# Altium project Carrier-Board-v1.0.PrjPcb (part 3 of 9)

## Sheet ETHERNET_INTERFACE.SchDoc
size A4; SheetNumber: 5; SheetTotal: 20
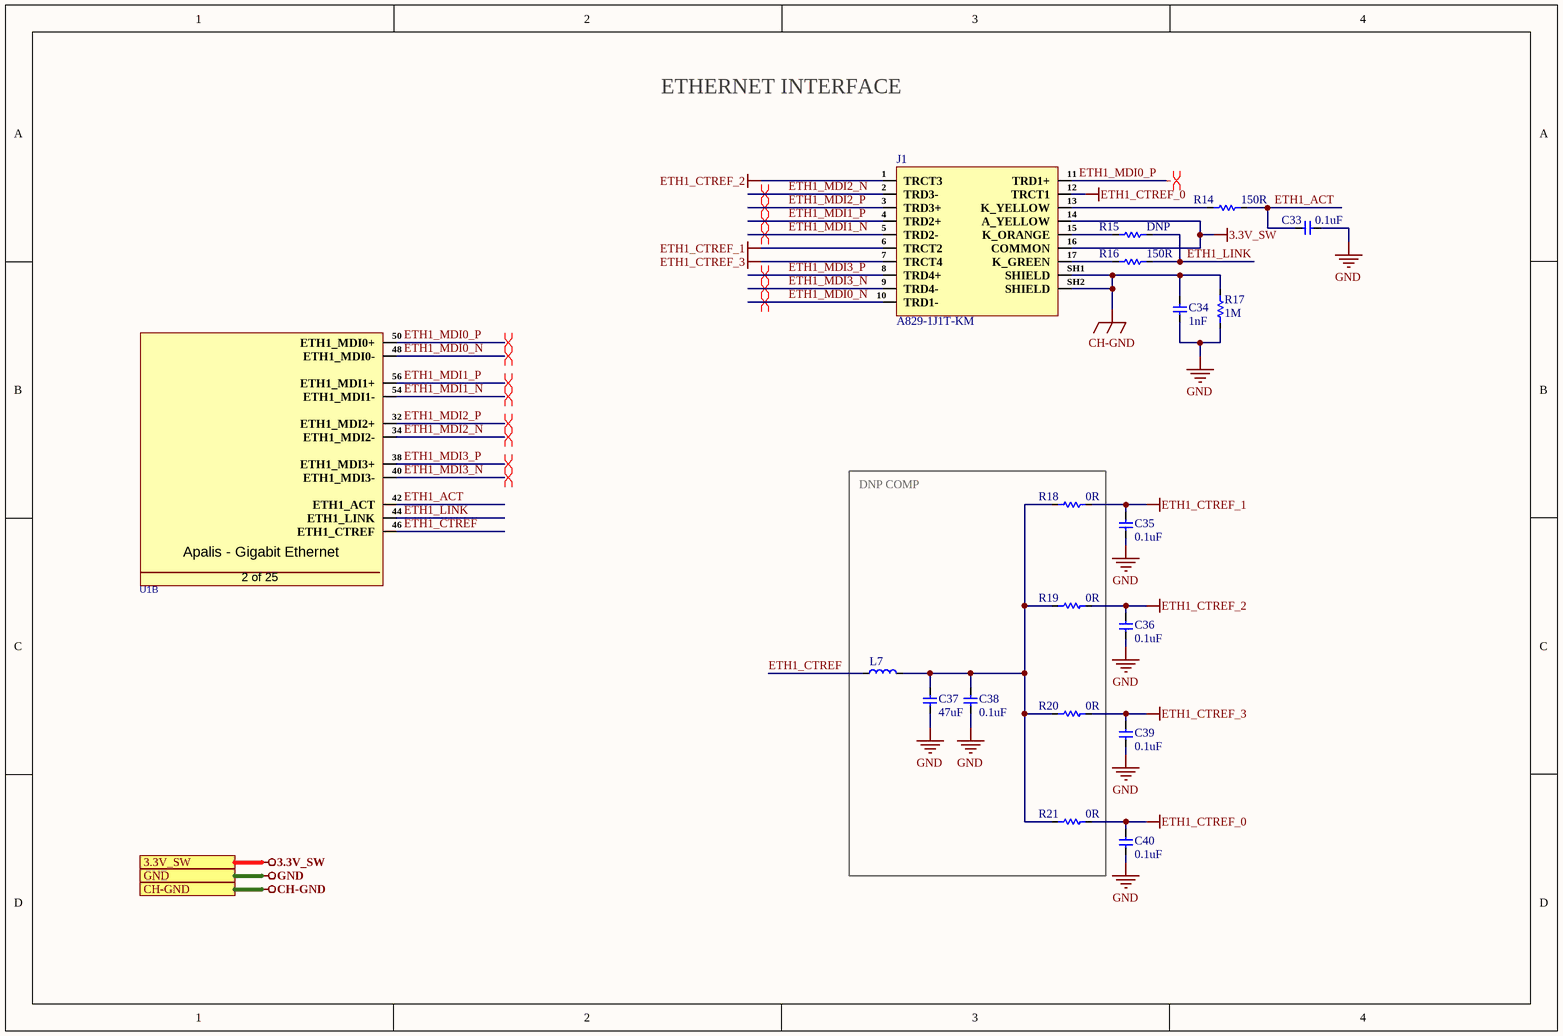
[diagram p4: ETHERNET_INTERFACE.SchDoc]

### Parts
C33  0.1uF  [Cap-0402]
C34  1nF  [Cap-1206]
C35  0.1uF  [Cap-0402]
C36  0.1uF  [Cap-0402]
C37  47uF  [Cap 2220]
C38  0.1uF  [Cap-0402]
C39  0.1uF  [Cap-0402]
C40  0.1uF  [Cap-0402]
J1  A829-1J1T-KM  [A829-1J1T-KM]
L7  BLM18EG221TN1D  [IND-0603 (1608 Metric)]  (value not drawn)
R14  150R  [Res-0402]
R15  DNP  [Res-0402]
R16  150R  [Res-0402]
R17  1M  [Res-0402]
R18  0R  [Res-0402]
R19  0R  [Res-0402]
R20  0R  [Res-0402]
R21  0R  [Res-0402]
U1  MM70-314B1-2-R300  [MM70-314B1-2-R300]  (value not drawn)  (part B of 25)

### Blocks framed on the sheet
DNP COMP: C37 C38 L7 R18-R21

### Ports
3.3V_SW (see Top_Sheet[1B], DIGITAL_I-O_O-P[1D], FUTURE_USE_CONNECTOR[1D], HDMI_INTERFACE[1D], I2C_INTERFACE[1B], MICRO_SD_CARD_INTERFACE[1D], UART_INTERFACE[1D]), CH-GND (see Top_Sheet[1B], HDMI_INTERFACE[1D], LTE_MODULE[1D], MECHANICAL_FOR_PCB[1D], USB3.0_INTERFACE[1D]), GND (see Top_Sheet[1B], 03-CAN2_SPI_CAN_CONTROLLER[1D], APALIS_POWER_SUPPLY[1D], CAN2_SPI_CAN_CONTROLLER[1D], CODEC_INTERFACE[1D], CONNECTORS[1D], DC_DC_CONVERTER[1D], DIGITAL_I-O_O-P[1D], FUTURE_USE_CONNECTOR[1D], GPIO_NC_INTERFACE[4B], HDMI_INTERFACE[1D], I2C_INTERFACE[1B], INPUT_SUPPLY_PROTECTION[1D], LTE_MODULE[1D], MECHANICAL_FOR_PCB[1D], MICRO_SD_CARD_INTERFACE[1D], Reset_and_SDIO[1D], UART_INTERFACE[1D], USB3.0_INTERFACE[1D])

### Nets
3.3V_SW: J1.14(A_YELLOW) J1.16(COMMON) ; port 3.3V_SW
CH-GND: C34.2 J1.SH1(SHIELD) J1.SH2(SHIELD) R17.2 ; port CH-GND
ETH1_CTREF_0: C40.2 J1.12(TRCT1) R21.2
ETH1_CTREF_1: C35.2 J1.6(TRCT2) R18.2
ETH1_CTREF_2: C36.2 J1.1(TRCT3) R19.2
ETH1_CTREF_3: C39.2 J1.7(TRCT4) R20.2
GND: C33.2 C34.1 C35.1 C36.1 C37.1 C38.1 C39.1 C40.1 R17.1 ; port GND
ETH1_ACT: C33.1 R14.2 U1.42(ETH1_ACT)
ETH1_CTREF: L7.1 U1.46(ETH1_CTREF)
ETH1_LINK: R15.2 R16.2 U1.44(ETH1_LINK)
ETH1_MDI0_N: J1.10(TRD1-) U1.48(ETH1_MDI0-)
ETH1_MDI0_P: J1.11(TRD1+) U1.50(ETH1_MDI0+)
ETH1_MDI1_N: J1.5(TRD2-) U1.54(ETH1_MDI1-)
ETH1_MDI1_P: J1.4(TRD2+) U1.56(ETH1_MDI1+)
ETH1_MDI2_N: J1.2(TRD3-) U1.34(ETH1_MDI2-)
ETH1_MDI2_P: J1.3(TRD3+) U1.32(ETH1_MDI2+)
ETH1_MDI3_N: J1.9(TRD4-) U1.40(ETH1_MDI3-)
ETH1_MDI3_P: J1.8(TRD4+) U1.38(ETH1_MDI3+)
NetC37_2: C37.2 C38.2 L7.2 R18.1 R19.1 R20.1 R21.1
NetJ1_13: J1.13(K_YELLOW) R14.1
NetJ1_15: J1.15(K_ORANGE) R15.1
NetJ1_17: J1.17(K_GREEN) R16.1

### Layout directives
differential pair; differential pair class DIFF-ETH-100; rule Impedance Constraint [Min = 98.00    Max = 103.0    ]; rule Matched Net Lengths [Tolerance = 0.508mm]: ETH1_MDI0_N, ETH1_MDI0_P, ETH1_MDI1_N, ETH1_MDI1_P, ETH1_MDI2_N, ETH1_MDI2_P, ETH1_MDI3_N, ETH1_MDI3_P

### Notes on the sheet
- ETHERNET INTERFACE
- (in symbol MM70-314B1-2-R300, part B) Apalis - Gigabit Ethernet; 2 of 25

### Library data of the parts
C33 C35 C36 C38-C40 = C0402C104K4REC7867: as C7 on sheet APALIS_POWER_SUPPLY; Supplier: Digi-Key; Supplier Part Number: 399-C0402C104K4REC7867CT-ND; Manufacturer Part Number: C0402C104K4REC7867; RoHS: No; Category: Ceramic Capacitors; Stock: 10918; Pricing: 1=0.1, 10=0.072, 50=0.0408, 100=0.0338, 500=0.02372, 1000=0.01963, 2500=0.01827, 5000=0.01672 (USD)
C34 = C1206C102KGRACAUTO: CAP CER 1000PF 2KV X7R 1206; Manufacturer: KEMET; Dielectric Material: Ceramic; Tolerance: 10%; Supplier: Mouser; Supplier Part Number: 80-C1206C102KGRAUTO; Manufacturer Part Number: C1206C102KGRACAUTO; RoHS: No; Category: Ceramic Capacitors; Stock: 90441; Pricing: 1=0.26, 10=0.119, 50=0.119, 100=0.072, 1000=0.063, 10000=0.052 (USD); Mounting Technology: Surface Mount; Case/Package: 1206; Case Code (Metric): 3216; Case Code (Imperial): 1206; Contact Plating: Tin,Matte; Min Operating Temperature: -55°C; Max Operating Temperature: 125°C; Voltage Rating: 2kV; Packaging: Cut Tape; Value: 1nF; Dielectric: X7R; Termination: SMD/SMT; Voltage Rating (DC): 2kV; Series: SMD Auto X7R HV; Construction: Flat; Length: 3.2mm; Ratings: AEC-Q200; Reach SVHC Compliant: No; RoHS Compliant: No; ComponentLink1URL: http://www.farnell.com/datasheets/2741171.pdf?src-supplier=Farnell; ComponentLink1Description: http://www.farnell.com/datasheets/2741171.pdf?src-supplier=Farnell; ComponentLink2URL: http://www.mouser.com/ds/2/212/KEM_C1010_X7R_HV_SMD-1102742.pdf?src-supplier=Mouser; ComponentLink2Description: http://www.mouser.com/ds/2/212/KEM_C1010_X7R_HV_SMD-1102742.pdf?src-supplier=Mouser; ComponentLink3URL: http://capacitoredge.kemet.com/capedge2/DataSheet/Datasheet-C1206C102KGRACAUTO.pdf?pn=C1206C102KGRACAUTO&src-supplier=Avnet; ComponentLink3Description: http://capacitoredge.kemet.com/capedge2/DataSheet/Datasheet-C1206C102KGRACAUTO.pdf?pn=C1206C102KGRACAUTO&src-supplier=Avnet; ComponentLink4URL: http://www.farnell.com/datasheets/2741171.pdf?src-supplier=Newark; ComponentLink4Description: http://www.farnell.com/datasheets/2741171.pdf?src-supplier=Newark; ComponentLink5URL: https://datasheet.octopart.com/C1206C102KGRACAUTO-Kemet-datasheet-41767101.pdf?src-supplier=Newark; ComponentLink5Description: https://datasheet.octopart.com/C1206C102KGRACAUTO-Kemet-datasheet-41767101.pdf?src-supplier=Newark; ComponentLink6URL: https://api.kemet.com/component-edge/download/datasheet/C1206C102KGRACAUTO.pdf?src-supplier=Digi-Key; ComponentLink6Description: https://api.kemet.com/component-edge/download/datasheet/C1206C102KGRACAUTO.pdf?src-supplier=Digi-Key; ComponentLink7URL: https://datasheet.octopart.com/C1206C102KGRACAUTO-KEMET-datasheet-149525142.pdf?src-supplier=Farnell; ComponentLink7Description: https://datasheet.octopart.com/C1206C102KGRACAUTO-KEMET-datasheet-149525142.pdf?src-supplier=Farnell; ComponentLink8URL: http://www.farnell.com/datasheets/2741171.pdf?src-supplier=Element14; ComponentLink8Description: http://www.farnell.com/datasheets/2741171.pdf?src-supplier=Element14; ComponentLink9URL: https://datasheet.octopart.com/C1206C102KGRACAUTO-Kemet-datasheet-66532414.pdf?src-supplier=Element14; ComponentLink9Description: https://datasheet.octopart.com/C1206C102KGRACAUTO-Kemet-datasheet-66532414.pdf?src-supplier=Element14; ComponentLink10URL: https://datasheet.octopart.com/C1206C102KGRACAUTO-KEMET-datasheet-140424778.pdf?src-supplier=TME; ComponentLink10Description: https://datasheet.octopart.com/C1206C102KGRACAUTO-KEMET-datasheet-140424778.pdf?src-supplier=TME; ComponentLink11URL: https://datasheet.octopart.com/C1206C102KGRACAUTO-KEMET-datasheet-147336163.pdf?src-supplier=LKR; ComponentLink11Description: https://datasheet.octopart.com/C1206C102KGRACAUTO-KEMET-datasheet-147336163.pdf?src-supplier=LKR
C37 = CGA9N3X7R1E476M230KB: CAP CER 47UF 25V X7R 2220; Manufacturer: TDK; Material: 4241ConductorMaterial; Tolerance: 20%; Supplier: Rs; Supplier Part Number: 2427522; Manufacturer Part Number: CGA9N3X7R1E476M230KB; RoHS: Yes; Category: Ceramic Capacitors; Stock: 467; Pricing: 1=3.07, 5=2.92, 10=2.76, 20=2.46, 100=2 (GBP); Mounting Technology: Surface Mount; Case/Package: 2220; Case Code (Imperial): 2220; Case Code (Metric): 5750; Min Operating Temperature: -55°C; Max Operating Temperature: 125°C; Packaging: Cut Tape; Value: 47uF; Voltage Rating: 25V; Series: CGA; Length: 5.7mm; Width: 5mm; Height: 2.8mm; Ratings: AEC-Q200; RoHS Compliant: Yes; ComponentLink1URL: https://product.tdk.com/info/en/catalog/spec/mlccspec_automotive_general_midvoltage_en.pdf?src-supplier=Digi-Key; ComponentLink1Description: https://product.tdk.com/info/en/catalog/spec/mlccspec_automotive_general_midvoltage_en.pdf?src-supplier=Digi-Key; ComponentLink2URL: https://product.tdk.com/info/en/catalog/datasheets/mlcc_automotive_general_en.pdf?src-supplier=Digi-Key; ComponentLink2Description: https://product.tdk.com/info/en/catalog/datasheets/mlcc_automotive_general_en.pdf?src-supplier=Digi-Key; ComponentLink3URL: https://product.tdk.com/info/en/catalog/datasheets/mlcc_automotive_general_en.pdf?ref_disty=digikey&src-supplier=Digi-Key; ComponentLink3Description: https://product.tdk.com/info/en/catalog/datasheets/mlcc_automotive_general_en.pdf?ref_disty=digikey&src-supplier=Digi-Key; ComponentLink4URL: https://datasheet.octopart.com/CGA9N3X7R1E476M230KB-TDK-datasheet-43366117.pdf?src-supplier=Future+Electronics; ComponentLink4Description: https://datasheet.octopart.com/CGA9N3X7R1E476M230KB-TDK-datasheet-43366117.pdf?src-supplier=Future+Electronics
J1 = A829-1J1T-KM: CONN JACK 1PORT 1000 BASE-TX PCB; Manufacturer: Bel; Supplier: Mouser; Supplier Part Number: 530-A829-1J1T-KM; Manufacturer Part Number: A829-1J1T-KM; RoHS: Yes; Category: Modular / Ethernet Connectors; Stock: 1152; Pricing: 1=7.48, 10=6.77, 50=6.4, 100=6.4, 1000=4.99, 10000=4.99 (USD); ComponentLink1URL: https://belfuse.com/resources/drawings/magneticsolutions/dr-mag-a829-1j1t-km.pdf?src-supplier=Digi-Key; ComponentLink1Description: https://belfuse.com/resources/drawings/magneticsolutions/dr-mag-a829-1j1t-km.pdf?src-supplier=Digi-Key; ComponentLink2URL: https://datasheet.octopart.com/A829-1J1T-KM-Bel-Fuse-datasheet-154547170.pdf?src-supplier=Electro+Sonic; ComponentLink2Description: https://datasheet.octopart.com/A829-1J1T-KM-Bel-Fuse-datasheet-154547170.pdf?src-supplier=Electro+Sonic
L7 = BLM18EG221TN1D: FERRITE BEAD 220 OHM 0603 1LN; Manufacturer: Murata; Supplier: Avnet; Supplier Part Number: BLM18EG221TN1D; Manufacturer Part Number: BLM18EG221TN1D; RoHS: Yes; Category: Ferrite Beads and Chips; Stock: 4000; Pricing: 4000=0.07735, 8000=0.07553, 16000=0.07371, 24000=0.07189, 32000=0.07007 (USD); ComponentLink1URL: https://datasheet.ciiva.com/11795/0900766b811b5866-11795384.pdf?src-supplier=Rs; ComponentLink1Description: https://datasheet.ciiva.com/11795/0900766b811b5866-11795384.pdf?src-supplier=Rs; ComponentLink2URL: https://datasheet.ciiva.com/41449/001172266-da-01-en-drossel-0603-220r-1-6x0-8mm-4000st-41449580.pdf?src-supplier=Conrad; ComponentLink2Description: https://datasheet.ciiva.com/41449/001172266-da-01-en-drossel-0603-220r-1-6x0-8mm-4000st-41449580.pdf?src-supplier=Conrad; ComponentLink3URL: https://datasheet.ciiva.com/1467/5169-1467159.pdf?src-supplier=Element14; ComponentLink3Description: https://datasheet.ciiva.com/1467/5169-1467159.pdf?src-supplier=Element14; ComponentLink4URL: https://datasheet.ciiva.com/1467/5169-1467160.pdf?src-supplier=Element14; ComponentLink4Description: https://datasheet.ciiva.com/1467/5169-1467160.pdf?src-supplier=Element14; ComponentLink5URL: https://datasheet.ciiva.com/8510/l0110s0101blm18e-8510167.pdf?src-supplier=Avnet; ComponentLink5Description: https://datasheet.ciiva.com/8510/l0110s0101blm18e-8510167.pdf?src-supplier=Avnet; ComponentLink6URL: https://datasheet.ciiva.com/16419/l0110s0101blm18e-16419150.pdf?src-supplier=Future+Electronics; ComponentLink6Description: https://datasheet.ciiva.com/16419/l0110s0101blm18e-16419150.pdf?src-supplier=Future+Electronics; ComponentLink7URL: https://datasheet.ciiva.com/6211/l0110s0101blm18e-6211853.pdf?src-supplier=Digi-Key; ComponentLink7Description: https://datasheet.ciiva.com/6211/l0110s0101blm18e-6211853.pdf?src-supplier=Digi-Key
R14-R16 = CRGCQ0402F150R: RES 150 OHM 1% 1/16W 0402; Manufacturer: TE Connectivity; Supplier: Arrow Electronics; Supplier Part Number: CRGCQ0402F150R; Manufacturer Part Number: CRGCQ0402F150R; RoHS: Yes; Category: Chip SMD Resistors; Stock: 712; Pricing: 1=0.0975, 10=0.0101, 25=0.01, 100=0.0051, 250=0.005, 500=0.0042 (USD); ComponentLink1URL: http://datasheet.octopart.com/CRGCQ0402F150R-TE-Connectivity-datasheet-114679081.pdf?src-supplier=Verical; ComponentLink1Description: http://datasheet.octopart.com/CRGCQ0402F150R-TE-Connectivity-datasheet-114679081.pdf?src-supplier=Verical; ComponentLink2URL: http://datasheet.octopart.com/CRGCQ0402F150R-TE-Connectivity-datasheet-114679081.pdf?src-supplier=Avnet; ComponentLink2Description: http://datasheet.octopart.com/CRGCQ0402F150R-TE-Connectivity-datasheet-114679081.pdf?src-supplier=Avnet; ComponentLink3URL: http://datasheet.octopart.com/CRGCQ0402F150R-TE-Connectivity-datasheet-114679081.pdf?src-supplier=Newark; ComponentLink3Description: http://datasheet.octopart.com/CRGCQ0402F150R-TE-Connectivity-datasheet-114679081.pdf?src-supplier=Newark; ComponentLink4URL: https://4donline.ihs.com/images/VipMasterIC/IC/TYEL/TYEL-S-A0004929575/TYEL-S-A0004929575-1.pdf?hkey=52A5661711E402568146F3353EA87419&src-supplier=Newark; ComponentLink4Description: https://4donline.ihs.com/images/VipMasterIC/IC/TYEL/TYEL-S-A0004929575/TYEL-S-A0004929575-1.pdf?hkey=52A5661711E402568146F3353EA87419&src-supplier=Newark; ComponentLink5URL: http://datasheet.octopart.com/CRGCQ0402F150R-TE-Connectivity-datasheet-114679081.pdf?src-supplier=Onlinecomponents.com; ComponentLink5Description: http://datasheet.octopart.com/CRGCQ0402F150R-TE-Connectivity-datasheet-114679081.pdf?src-supplier=Onlinecomponents.com; ComponentLink6URL: https://4donline.ihs.com/images/VipMasterIC/IC/TYEL/TYEL-S-A0004929575/TYEL-S-A0004929575-1.pdf?hkey=52A5661711E402568146F3353EA87419&src-supplier=Farnell; ComponentLink6Description: https://4donline.ihs.com/images/VipMasterIC/IC/TYEL/TYEL-S-A0004929575/TYEL-S-A0004929575-1.pdf?hkey=52A5661711E402568146F3353EA87419&src-supplier=Farnell; ComponentLink7URL: http://datasheet.octopart.com/CRGCQ0402F150R-TE-Connectivity-datasheet-114679081.pdf?src-supplier=Mouser; ComponentLink7Description: http://datasheet.octopart.com/CRGCQ0402F150R-TE-Connectivity-datasheet-114679081.pdf?src-supplier=Mouser; ComponentLink8URL: https://www.te.com/commerce/DocumentDelivery/DDEController?Action=srchrtrv&DocNm=1773204-3&DocType=DS&DocLang=English&src-supplier=Digi-Key; ComponentLink8Description: https://www.te.com/commerce/DocumentDelivery/DDEController?Action=srchrtrv&DocNm=1773204-3&DocType=DS&DocLang=English&src-supplier=Digi-Key; ComponentLink9URL: http://datasheet.octopart.com/CRGCQ0402F150R-TE-Connectivity-datasheet-114679081.pdf?src-supplier=Digi-Key; ComponentLink9Description: http://datasheet.octopart.com/CRGCQ0402F150R-TE-Connectivity-datasheet-114679081.pdf?src-supplier=Digi-Key; ComponentLink10URL: http://datasheet.octopart.com/CRGCQ0402F150R-TE-Connectivity-datasheet-114679081.pdf?src-supplier=Heilind+Electronics; ComponentLink10Description: http://datasheet.octopart.com/CRGCQ0402F150R-TE-Connectivity-datasheet-114679081.pdf?src-supplier=Heilind+Electronics; ComponentLink11URL: http://datasheet.octopart.com/CRGCQ0402F150R-TE-Connectivity-datasheet-114679081.pdf?src-supplier=Electro+Sonic; ComponentLink11Description: http://datasheet.octopart.com/CRGCQ0402F150R-TE-Connectivity-datasheet-114679081.pdf?src-supplier=Electro+Sonic; ComponentLink12URL: http://datasheet.octopart.com/CRGCQ0402F150R-TE-Connectivity-datasheet-114679081.pdf?src-supplier=Interstate+Connecting+Components; ComponentLink12Description: http://datasheet.octopart.com/CRGCQ0402F150R-TE-Connectivity-datasheet-114679081.pdf?src-supplier=Interstate+Connecting+Components; ComponentLink13URL: http://datasheet.octopart.com/CRGCQ0402F150R-TE-Connectivity-datasheet-114679081.pdf?src-supplier=TME; ComponentLink13Description: http://datasheet.octopart.com/CRGCQ0402F150R-TE-Connectivity-datasheet-114679081.pdf?src-supplier=TME; ComponentLink14URL: http://datasheet.octopart.com/CRGCQ0402F150R-TE-Connectivity-datasheet-114679081.pdf?src-supplier=Sager+Electronics; ComponentLink14Description: http://datasheet.octopart.com/CRGCQ0402F150R-TE-Connectivity-datasheet-114679081.pdf?src-supplier=Sager+Electronics; ComponentLink15URL: https://datasheet.octopart.com/CRGCQ0402F150R-TE-Connectivity-datasheet-114679081.pdf?src-supplier=Master+Electronics; ComponentLink15Description: https://datasheet.octopart.com/CRGCQ0402F150R-TE-Connectivity-datasheet-114679081.pdf?src-supplier=Master+Electronics
R17 = CRGCQ0402J1M0: RES 1M OHM 5% 1/16W 0402; Manufacturer: TE Connectivity; Value: 1MR; Max Power Dissipation: 63mW; Temperature Coefficient: 100ppm/°C; Power Rating: 62.5mW; Voltage Rating: 50V; Supplier: Arrow Electronics; Supplier Part Number: CRGCQ0402J1M0; Manufacturer Part Number: CRGCQ0402J1M0; RoHS: Yes; Category: Chip SMD Resistors; Stock: 50000; Pricing: 20000=0.0015 (USD); Case/Package: 0402; Case Code (Imperial): 0402; Case Code (Metric): 1005; Min Operating Temperature: -55°C; Max Operating Temperature: 155°C; Features: Moisture Resistant,Automotive AEC-Q200; Packaging: Cut Tape; Tolerance: 5%; Number of Terminations: 2; Series: CRGCQ; Voltage Rating (DC): 50V; Height: 400um; Ratings: AEC-Q200; RoHS Compliant: Yes; ComponentLink1URL: http://datasheet.octopart.com/CRGCQ0402J1M0-TE-Connectivity-datasheet-114679081.pdf?src-supplier=Mouser; ComponentLink1Description: http://datasheet.octopart.com/CRGCQ0402J1M0-TE-Connectivity-datasheet-114679081.pdf?src-supplier=Mouser; ComponentLink2URL: http://datasheet.octopart.com/CRGCQ0402J1M0-TE-Connectivity-datasheet-114679081.pdf?src-supplier=Arrow+Electronics; ComponentLink2Description: http://datasheet.octopart.com/CRGCQ0402J1M0-TE-Connectivity-datasheet-114679081.pdf?src-supplier=Arrow+Electronics; ComponentLink3URL: http://datasheet.octopart.com/CRGCQ0402J1M0-TE-Connectivity-datasheet-114679081.pdf?src-supplier=Onlinecomponents.com; ComponentLink3Description: http://datasheet.octopart.com/CRGCQ0402J1M0-TE-Connectivity-datasheet-114679081.pdf?src-supplier=Onlinecomponents.com; ComponentLink4URL: http://datasheet.octopart.com/CRGCQ0402J1M0-TE-Connectivity-datasheet-114679081.pdf?src-supplier=Digi-Key; ComponentLink4Description: http://datasheet.octopart.com/CRGCQ0402J1M0-TE-Connectivity-datasheet-114679081.pdf?src-supplier=Digi-Key; ComponentLink5URL: http://datasheet.octopart.com/CRGCQ0402J1M0-TE-Connectivity-datasheet-114679081.pdf?src-supplier=Verical; ComponentLink5Description: http://datasheet.octopart.com/CRGCQ0402J1M0-TE-Connectivity-datasheet-114679081.pdf?src-supplier=Verical; ComponentLink6URL: https://www.te.com/commerce/DocumentDelivery/DDEController?Action=srchrtrv&DocNm=1773204-3&DocType=DS&DocLang=English&src-supplier=Digi-Key; ComponentLink6Description: https://www.te.com/commerce/DocumentDelivery/DDEController?Action=srchrtrv&DocNm=1773204-3&DocType=DS&DocLang=English&src-supplier=Digi-Key; ComponentLink7URL: http://datasheet.octopart.com/CRGCQ0402J1M0-TE-Connectivity-datasheet-114679081.pdf?src-supplier=Newark; ComponentLink7Description: http://datasheet.octopart.com/CRGCQ0402J1M0-TE-Connectivity-datasheet-114679081.pdf?src-supplier=Newark; ComponentLink8URL: http://datasheet.octopart.com/CRGCQ0402J1M0-TE-Connectivity-datasheet-114679081.pdf?src-supplier=Avnet; ComponentLink8Description: http://datasheet.octopart.com/CRGCQ0402J1M0-TE-Connectivity-datasheet-114679081.pdf?src-supplier=Avnet; ComponentLink9URL: http://datasheet.octopart.com/CRGCQ0402J1M0-TE-Connectivity-datasheet-114679081.pdf?src-supplier=Farnell; ComponentLink9Description: http://datasheet.octopart.com/CRGCQ0402J1M0-TE-Connectivity-datasheet-114679081.pdf?src-supplier=Farnell; ComponentLink10URL: http://datasheet.octopart.com/CRGCQ0402J1M0-TE-Connectivity-datasheet-114679081.pdf?src-supplier=Sager+Electronics; ComponentLink10Description: http://datasheet.octopart.com/CRGCQ0402J1M0-TE-Connectivity-datasheet-114679081.pdf?src-supplier=Sager+Electronics; ComponentLink11URL: http://datasheet.octopart.com/CRGCQ0402J1M0-TE-Connectivity-datasheet-114679081.pdf?src-supplier=TME; ComponentLink11Description: http://datasheet.octopart.com/CRGCQ0402J1M0-TE-Connectivity-datasheet-114679081.pdf?src-supplier=TME; ComponentLink12URL: http://datasheet.octopart.com/CRGCQ0402J1M0-TE-Connectivity-datasheet-114679081.pdf?src-supplier=Electro+Sonic; ComponentLink12Description: http://datasheet.octopart.com/CRGCQ0402J1M0-TE-Connectivity-datasheet-114679081.pdf?src-supplier=Electro+Sonic; ComponentLink13URL: http://datasheet.octopart.com/CRGCQ0402J1M0-TE-Connectivity-datasheet-114679081.pdf?src-supplier=Interstate+Connecting+Components; ComponentLink13Description: http://datasheet.octopart.com/CRGCQ0402J1M0-TE-Connectivity-datasheet-114679081.pdf?src-supplier=Interstate+Connecting+Components; ComponentLink14URL: http://datasheet.octopart.com/CRGCQ0402J1M0-TE-Connectivity-datasheet-114679081.pdf?src-supplier=Heilind+Electronics; ComponentLink14Description: http://datasheet.octopart.com/CRGCQ0402J1M0-TE-Connectivity-datasheet-114679081.pdf?src-supplier=Heilind+Electronics; ComponentLink15URL: https://datasheet.octopart.com/CRGCQ0402J1M0-TE-Connectivity-datasheet-114679081.pdf?src-supplier=Master+Electronics; ComponentLink15Description: https://datasheet.octopart.com/CRGCQ0402J1M0-TE-Connectivity-datasheet-114679081.pdf?src-supplier=Master+Electronics
R18-R21 = ERJ-2GE0R00X: as R1 on sheet APALIS_POWER_SUPPLY; Supplier: Mouser; Supplier Part Number: 667-ERJ-2GE0R00X; Manufacturer Part Number: ERJ-2GE0R00X; RoHS: Yes; Category: Chip SMD Resistors; Stock: 10959876; Pricing: 1=0.1, 10=0.013, 50=0.013, 100=0.006, 1000=0.004, 10000=0.003 (USD); Mounting Technology: Surface Mount; Case/Package: 0402; Pins: 2NUMBER; Contact Plating: Tin; Case Code (Metric): 1005; Case Code (Imperial): 0402; Min Operating Temperature: -55°C; Max Operating Temperature: 155°C; Resistor Type: Thick Film; Packaging: Cut Tape; Package Quantity: 10000; Number of Terminations: 2; Termination: SMD/SMT; Max Power Dissipation: 100mW; Voltage Rating (DC): 50V; Features: Automotive AEC-Q200; Series: ERJ; Construction: Rectangular; Technology: THICK FILM; Length: 1mm; Width: 0.5mm; Height: 0.35mm; Depth: 0.5mm; Ratings: AEC-Q200; Radiation Hardening: No; Reach SVHC Compliant: No; Military Standard: Not; Lead Free: Lead Free; RoHS Compliant: Yes; ComponentLink1URL: https://datasheet.ciiva.com/11821/0900766b80f806dd-11821176.pdf?src-supplier=Rs; ComponentLink1Description: https://datasheet.ciiva.com/11821/0900766b80f806dd-11821176.pdf?src-supplier=Rs; ComponentLink2URL: https://datasheet.ciiva.com/46389/1678796-46389518.pdf?src-supplier=Element14; ComponentLink2Description: https://datasheet.ciiva.com/46389/1678796-46389518.pdf?src-supplier=Element14; ComponentLink3URL: https://datasheet.ciiva.com/28695/1678796-28695758.pdf?src-supplier=Element14; ComponentLink3Description: https://datasheet.ciiva.com/28695/1678796-28695758.pdf?src-supplier=Element14; ComponentLink4URL: https://datasheet.ciiva.com/16778/70260739-16778335.pdf?src-supplier=Allied+Electronics; ComponentLink4Description: https://datasheet.ciiva.com/16778/70260739-16778335.pdf?src-supplier=Allied+Electronics; ComponentLink5URL: https://datasheet.ciiva.com/48531/aoa0000ce1-48531077.pdf?src-supplier=Avnet; ComponentLink5Description: https://datasheet.ciiva.com/48531/aoa0000ce1-48531077.pdf?src-supplier=Avnet; ComponentLink6URL: https://datasheet.ciiva.com/30097/4aoa0000ce1-30097116.pdf?src-supplier=Onlinecomponents.com; ComponentLink6Description: https://datasheet.ciiva.com/30097/4aoa0000ce1-30097116.pdf?src-supplier=Onlinecomponents.com; ComponentLink7URL: https://datasheet.ciiva.com/43460/1678796-43460347.pdf?src-supplier=Farnell; ComponentLink7Description: https://datasheet.ciiva.com/43460/1678796-43460347.pdf?src-supplier=Farnell; ComponentLink8URL: https://datasheet.ciiva.com/5959/1678796-5959692.pdf?src-supplier=Farnell; ComponentLink8Description: https://datasheet.ciiva.com/5959/1678796-5959692.pdf?src-supplier=Farnell; ComponentLink9URL: https://datasheet.ciiva.com/16783/70260739-16783734.pdf?src-supplier=Allied+Electronics; ComponentLink9Description: https://datasheet.ciiva.com/16783/70260739-16783734.pdf?src-supplier=Allied+Electronics
U1 = MM70-314B1-2-R300: as U1 on sheet APALIS_POWER_SUPPLY; Supplier: Digi-Key; Supplier Part Number: 670-MM70-314B1-2-R300CT-ND; Manufacturer Part Number: MM70-314B1-2-R300; RoHS: No; Category: Card Edge Connectors; Stock: 4979; Pricing: 1=9.21, 10=8.287, 25=7.8064, 50=7.6064, 100=7.4062 (USD)

## Sheet HDMI_INTERFACE.SchDoc
size A4; SheetNumber: 6; SheetTotal: 20
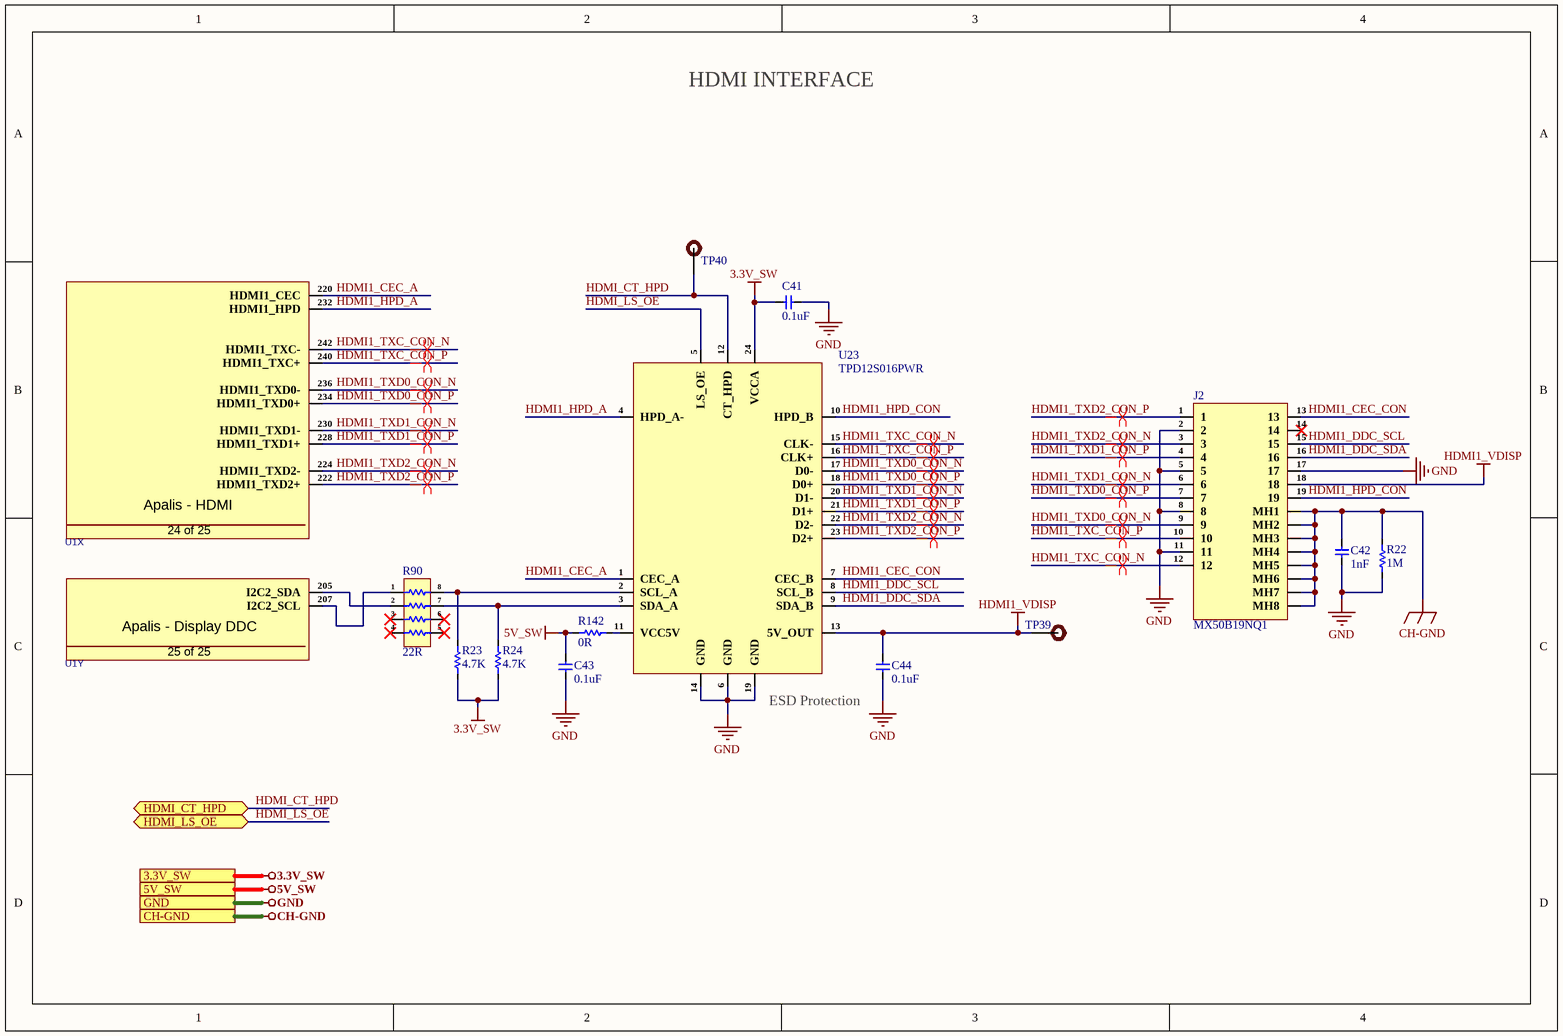
[diagram p5: HDMI_INTERFACE.SchDoc]

### Parts
C41  0.1uF  [Cap-0402]
C42  1nF  [Cap-1206]
C43  0.1uF  [Cap-0402]
C44  0.1uF  [Cap-0402]
J2  MX50B19NQ1  [MX50B19NQ1]
R22  1M  [Res-0402]
R23  4.7K  [Res-0603]
R24  4.7K  [Res-0603]
R90  22R  [YC164-JR-0722RL]
R142  0R  [Res-1206]
TP39  DNP  [Test-point]  (value not drawn)
TP40  DNP  [Test-point]  (value not drawn)
U1  MM70-314B1-2-R300  [MM70-314B1-2-R300]  (value not drawn)  (parts X,Y of 25)
U23  TPD12S016PWR  [24-TSSOP]

### Ports
3.3V_SW (see Top_Sheet[1C], DIGITAL_I-O_O-P[1D], ETHERNET_INTERFACE[1D], FUTURE_USE_CONNECTOR[1D], I2C_INTERFACE[1B], MICRO_SD_CARD_INTERFACE[1D], UART_INTERFACE[1D]), 5V_SW (see Top_Sheet[1C], APALIS_POWER_SUPPLY[1D], CODEC_INTERFACE[1D], FUTURE_USE_CONNECTOR[1D], LTE_MODULE[1D], USB3.0_INTERFACE[1D]), CH-GND (see Top_Sheet[1C], ETHERNET_INTERFACE[1D], LTE_MODULE[1D], MECHANICAL_FOR_PCB[1D], USB3.0_INTERFACE[1D]), GND (see Top_Sheet[1C], 03-CAN2_SPI_CAN_CONTROLLER[1D], APALIS_POWER_SUPPLY[1D], CAN2_SPI_CAN_CONTROLLER[1D], CODEC_INTERFACE[1D], CONNECTORS[1D], DC_DC_CONVERTER[1D], DIGITAL_I-O_O-P[1D], ETHERNET_INTERFACE[1D], FUTURE_USE_CONNECTOR[1D], GPIO_NC_INTERFACE[4B], I2C_INTERFACE[1B], INPUT_SUPPLY_PROTECTION[1D], LTE_MODULE[1D], MECHANICAL_FOR_PCB[1D], MICRO_SD_CARD_INTERFACE[1D], Reset_and_SDIO[1D], UART_INTERFACE[1D], USB3.0_INTERFACE[1D]), HDMI_CT_HPD (bidir, see Top_Sheet[1C], GPIO_NC_INTERFACE[3D]), HDMI_LS_OE (bidir, see Top_Sheet[1C], GPIO_NC_INTERFACE[3D])

### Nets
3.3V_SW: C41.2 R23.1 R24.1 U23.24(VCCA) ; port 3.3V_SW
5V_SW: C43.2 R142.1 ; port 5V_SW
CH-GND: C42.2 J2.MH1 J2.MH2 J2.MH3 J2.MH4 J2.MH5 J2.MH6 J2.MH7 J2.MH8 R22.2 ; port CH-GND
GND: C41.1 C42.1 C43.1 C44.1 J2.2 J2.5 J2.8 J2.11 J2.17 R22.1 U23.6(GND) U23.14(GND) U23.19(GND) ; port GND
HDMI1_VDISP: C44.2 J2.18 TP39.1 U23.13(5V_OUT)
HDMI1_CEC_A: U1.220(HDMI1_CEC) U23.1(CEC_A)
HDMI1_CEC_CON: J2.13 U23.7(CEC_B)
HDMI1_DDC_SCL: J2.15 U23.8(SCL_B)
HDMI1_DDC_SDA: J2.16 U23.9(SDA_B)
HDMI1_HPD_A: U1.232(HDMI1_HPD) U23.4(HPD_A-)
HDMI1_HPD_CON: J2.19 U23.10(HPD_B)
HDMI1_TXC_CON_N: J2.12 U1.242(HDMI1_TXC-) U23.15(CLK-)
HDMI1_TXC_CON_P: J2.10 U1.240(HDMI1_TXC+) U23.16(CLK+)
HDMI1_TXD0_CON_N: J2.9 U1.236(HDMI1_TXD0-) U23.17(D0-)
HDMI1_TXD0_CON_P: J2.7 U1.234(HDMI1_TXD0+) U23.18(D0+)
HDMI1_TXD1_CON_N: J2.6 U1.230(HDMI1_TXD1-) U23.20(D1-)
HDMI1_TXD1_CON_P: J2.4 U1.228(HDMI1_TXD1+) U23.21(D1+)
HDMI1_TXD2_CON_N: J2.3 U1.224(HDMI1_TXD2-) U23.22(D2-)
HDMI1_TXD2_CON_P: J2.1 U1.222(HDMI1_TXD2+) U23.23(D2+)
HDMI_CT_HPD: TP40.1 U23.12(CT_HPD) ; port HDMI_CT_HPD
HDMI_LS_OE: U23.5(LS_OE) ; port HDMI_LS_OE
NetR23_2: R23.2 R90.8 U23.2(SCL_A)
NetR24_2: R24.2 R90.7 U23.3(SDA_A)
NetR90_1: R90.1 U1.207(I2C2_SCL)
NetR90_2: R90.2 U1.205(I2C2_SDA)
NetR142_2: R142.2 U23.11(VCC5V)

Not connected (* = marked no-connect by the designer): J2 14*; R90 3* 4* 5* 6*

### Layout directives
differential pair; differential pair class HDMI; rule Matched Net Lengths [Tolerance = 0.508mm]; rule Impedance Constraint [Min = 98.00    Max = 102.0    ]: HDMI1_TXC_CON_N, HDMI1_TXC_CON_P, HDMI1_TXD0_CON_N, HDMI1_TXD0_CON_P, HDMI1_TXD1_CON_N, HDMI1_TXD1_CON_P, HDMI1_TXD2_CON_N, HDMI1_TXD2_CON_P

### Notes on the sheet
- HDMI INTERFACE
- ESD Protection
- (in symbol MM70-314B1-2-R300, part X) Apalis - HDMI; 24 of 25
- (in symbol MM70-314B1-2-R300, part Y) Apalis - Display DDC; 25 of 25

### Library data of the parts
C41 C43 C44 = C0402C104K4REC7867: as C7 on sheet APALIS_POWER_SUPPLY; Supplier: Digi-Key; Supplier Part Number: 399-C0402C104K4REC7867CT-ND; Manufacturer Part Number: C0402C104K4REC7867; RoHS: No; Category: Ceramic Capacitors; Stock: 10918; Pricing: 1=0.1, 10=0.072, 50=0.0408, 100=0.0338, 500=0.02372, 1000=0.01963, 2500=0.01827, 5000=0.01672 (USD)
C42 = C1206C102KGRACAUTO: as C34 on sheet ETHERNET_INTERFACE; Supplier: Mouser; Supplier Part Number: 80-C1206C102KGRAUTO; Manufacturer Part Number: C1206C102KGRACAUTO; RoHS: No; Category: Ceramic Capacitors; Stock: 90441; Pricing: 1=0.26, 10=0.119, 50=0.119, 100=0.072, 1000=0.063, 10000=0.052 (USD); Mounting Technology: Surface Mount; Case/Package: 1206; Case Code (Metric): 3216; Case Code (Imperial): 1206; Contact Plating: Tin,Matte; Min Operating Temperature: -55°C; Max Operating Temperature: 125°C; Voltage Rating: 2kV; Packaging: Cut Tape; Value: 1nF; Dielectric: X7R; Termination: SMD/SMT; Voltage Rating (DC): 2kV; Series: SMD Auto X7R HV; Construction: Flat; Length: 3.2mm; Ratings: AEC-Q200; Reach SVHC Compliant: No; RoHS Compliant: No; ComponentLink1URL: http://www.farnell.com/datasheets/2741171.pdf?src-supplier=Farnell; ComponentLink1Description: http://www.farnell.com/datasheets/2741171.pdf?src-supplier=Farnell; ComponentLink2URL: http://www.mouser.com/ds/2/212/KEM_C1010_X7R_HV_SMD-1102742.pdf?src-supplier=Mouser; ComponentLink2Description: http://www.mouser.com/ds/2/212/KEM_C1010_X7R_HV_SMD-1102742.pdf?src-supplier=Mouser; ComponentLink3URL: http://capacitoredge.kemet.com/capedge2/DataSheet/Datasheet-C1206C102KGRACAUTO.pdf?pn=C1206C102KGRACAUTO&src-supplier=Avnet; ComponentLink3Description: http://capacitoredge.kemet.com/capedge2/DataSheet/Datasheet-C1206C102KGRACAUTO.pdf?pn=C1206C102KGRACAUTO&src-supplier=Avnet; ComponentLink4URL: http://www.farnell.com/datasheets/2741171.pdf?src-supplier=Newark; ComponentLink4Description: http://www.farnell.com/datasheets/2741171.pdf?src-supplier=Newark; ComponentLink5URL: https://datasheet.octopart.com/C1206C102KGRACAUTO-Kemet-datasheet-41767101.pdf?src-supplier=Newark; ComponentLink5Description: https://datasheet.octopart.com/C1206C102KGRACAUTO-Kemet-datasheet-41767101.pdf?src-supplier=Newark; ComponentLink6URL: https://api.kemet.com/component-edge/download/datasheet/C1206C102KGRACAUTO.pdf?src-supplier=Digi-Key; ComponentLink6Description: https://api.kemet.com/component-edge/download/datasheet/C1206C102KGRACAUTO.pdf?src-supplier=Digi-Key; ComponentLink7URL: https://datasheet.octopart.com/C1206C102KGRACAUTO-KEMET-datasheet-149525142.pdf?src-supplier=Farnell; ComponentLink7Description: https://datasheet.octopart.com/C1206C102KGRACAUTO-KEMET-datasheet-149525142.pdf?src-supplier=Farnell; ComponentLink8URL: http://www.farnell.com/datasheets/2741171.pdf?src-supplier=Element14; ComponentLink8Description: http://www.farnell.com/datasheets/2741171.pdf?src-supplier=Element14; ComponentLink9URL: https://datasheet.octopart.com/C1206C102KGRACAUTO-Kemet-datasheet-66532414.pdf?src-supplier=Element14; ComponentLink9Description: https://datasheet.octopart.com/C1206C102KGRACAUTO-Kemet-datasheet-66532414.pdf?src-supplier=Element14; ComponentLink10URL: https://datasheet.octopart.com/C1206C102KGRACAUTO-KEMET-datasheet-140424778.pdf?src-supplier=TME; ComponentLink10Description: https://datasheet.octopart.com/C1206C102KGRACAUTO-KEMET-datasheet-140424778.pdf?src-supplier=TME; ComponentLink11URL: https://datasheet.octopart.com/C1206C102KGRACAUTO-KEMET-datasheet-147336163.pdf?src-supplier=LKR; ComponentLink11Description: https://datasheet.octopart.com/C1206C102KGRACAUTO-KEMET-datasheet-147336163.pdf?src-supplier=LKR
J2 = MX50B19NQ1: Automotive Connectors HDMI Type E Connector, 19 pos., Receptacle, Without Flange; Manufacturer: JAE Electronics; Supplier: Digi-Key; Supplier Part Number: 670-MX50B19NQ1-ND; Manufacturer Part Number: MX50B19NQ1; RoHS: No; Category: Uncategorized; Pricing: 140=3.65621 (USD)
R22 = CRGCQ0402J1M0: as R17 on sheet ETHERNET_INTERFACE; Supplier: Arrow Electronics; Supplier Part Number: CRGCQ0402J1M0; Manufacturer Part Number: CRGCQ0402J1M0; RoHS: Yes; Category: Chip SMD Resistors; Stock: 50000; Pricing: 20000=0.0015 (USD); Case/Package: 0402; Case Code (Imperial): 0402; Case Code (Metric): 1005; Min Operating Temperature: -55°C; Max Operating Temperature: 155°C; Features: Moisture Resistant,Automotive AEC-Q200; Packaging: Cut Tape; Tolerance: 5%; Number of Terminations: 2; Series: CRGCQ; Voltage Rating (DC): 50V; Height: 400um; Ratings: AEC-Q200; RoHS Compliant: Yes; ComponentLink1URL: http://datasheet.octopart.com/CRGCQ0402J1M0-TE-Connectivity-datasheet-114679081.pdf?src-supplier=Mouser; ComponentLink1Description: http://datasheet.octopart.com/CRGCQ0402J1M0-TE-Connectivity-datasheet-114679081.pdf?src-supplier=Mouser; ComponentLink2URL: http://datasheet.octopart.com/CRGCQ0402J1M0-TE-Connectivity-datasheet-114679081.pdf?src-supplier=Arrow+Electronics; ComponentLink2Description: http://datasheet.octopart.com/CRGCQ0402J1M0-TE-Connectivity-datasheet-114679081.pdf?src-supplier=Arrow+Electronics; ComponentLink3URL: http://datasheet.octopart.com/CRGCQ0402J1M0-TE-Connectivity-datasheet-114679081.pdf?src-supplier=Onlinecomponents.com; ComponentLink3Description: http://datasheet.octopart.com/CRGCQ0402J1M0-TE-Connectivity-datasheet-114679081.pdf?src-supplier=Onlinecomponents.com; ComponentLink4URL: http://datasheet.octopart.com/CRGCQ0402J1M0-TE-Connectivity-datasheet-114679081.pdf?src-supplier=Digi-Key; ComponentLink4Description: http://datasheet.octopart.com/CRGCQ0402J1M0-TE-Connectivity-datasheet-114679081.pdf?src-supplier=Digi-Key; ComponentLink5URL: http://datasheet.octopart.com/CRGCQ0402J1M0-TE-Connectivity-datasheet-114679081.pdf?src-supplier=Verical; ComponentLink5Description: http://datasheet.octopart.com/CRGCQ0402J1M0-TE-Connectivity-datasheet-114679081.pdf?src-supplier=Verical; ComponentLink6URL: https://www.te.com/commerce/DocumentDelivery/DDEController?Action=srchrtrv&DocNm=1773204-3&DocType=DS&DocLang=English&src-supplier=Digi-Key; ComponentLink6Description: https://www.te.com/commerce/DocumentDelivery/DDEController?Action=srchrtrv&DocNm=1773204-3&DocType=DS&DocLang=English&src-supplier=Digi-Key; ComponentLink7URL: http://datasheet.octopart.com/CRGCQ0402J1M0-TE-Connectivity-datasheet-114679081.pdf?src-supplier=Newark; ComponentLink7Description: http://datasheet.octopart.com/CRGCQ0402J1M0-TE-Connectivity-datasheet-114679081.pdf?src-supplier=Newark; ComponentLink8URL: http://datasheet.octopart.com/CRGCQ0402J1M0-TE-Connectivity-datasheet-114679081.pdf?src-supplier=Avnet; ComponentLink8Description: http://datasheet.octopart.com/CRGCQ0402J1M0-TE-Connectivity-datasheet-114679081.pdf?src-supplier=Avnet; ComponentLink9URL: http://datasheet.octopart.com/CRGCQ0402J1M0-TE-Connectivity-datasheet-114679081.pdf?src-supplier=Farnell; ComponentLink9Description: http://datasheet.octopart.com/CRGCQ0402J1M0-TE-Connectivity-datasheet-114679081.pdf?src-supplier=Farnell; ComponentLink10URL: http://datasheet.octopart.com/CRGCQ0402J1M0-TE-Connectivity-datasheet-114679081.pdf?src-supplier=Sager+Electronics; ComponentLink10Description: http://datasheet.octopart.com/CRGCQ0402J1M0-TE-Connectivity-datasheet-114679081.pdf?src-supplier=Sager+Electronics; ComponentLink11URL: http://datasheet.octopart.com/CRGCQ0402J1M0-TE-Connectivity-datasheet-114679081.pdf?src-supplier=TME; ComponentLink11Description: http://datasheet.octopart.com/CRGCQ0402J1M0-TE-Connectivity-datasheet-114679081.pdf?src-supplier=TME; ComponentLink12URL: http://datasheet.octopart.com/CRGCQ0402J1M0-TE-Connectivity-datasheet-114679081.pdf?src-supplier=Electro+Sonic; ComponentLink12Description: http://datasheet.octopart.com/CRGCQ0402J1M0-TE-Connectivity-datasheet-114679081.pdf?src-supplier=Electro+Sonic; ComponentLink13URL: http://datasheet.octopart.com/CRGCQ0402J1M0-TE-Connectivity-datasheet-114679081.pdf?src-supplier=Interstate+Connecting+Components; ComponentLink13Description: http://datasheet.octopart.com/CRGCQ0402J1M0-TE-Connectivity-datasheet-114679081.pdf?src-supplier=Interstate+Connecting+Components; ComponentLink14URL: http://datasheet.octopart.com/CRGCQ0402J1M0-TE-Connectivity-datasheet-114679081.pdf?src-supplier=Heilind+Electronics; ComponentLink14Description: http://datasheet.octopart.com/CRGCQ0402J1M0-TE-Connectivity-datasheet-114679081.pdf?src-supplier=Heilind+Electronics; ComponentLink15URL: https://datasheet.octopart.com/CRGCQ0402J1M0-TE-Connectivity-datasheet-114679081.pdf?src-supplier=Master+Electronics; ComponentLink15Description: https://datasheet.octopart.com/CRGCQ0402J1M0-TE-Connectivity-datasheet-114679081.pdf?src-supplier=Master+Electronics
R23 R24 = ERA-3AEB472V: as R8 on sheet 03-CAN2_SPI_CAN_CONTROLLER; Supplier: Rs; Supplier Part Number: 566888P; Manufacturer Part Number: ERA-3AEB472V; RoHS: Yes; Category: Chip SMD Resistors; Stock: 5210; Pricing: 50=0.242, 100=0.198, 250=0.156, 500=0.114 (GBP); ComponentLink1URL: https://datasheet.ciiva.com/11808/0900766b80fe20f7-11808039.pdf?src-supplier=Rs; ComponentLink1Description: https://datasheet.ciiva.com/11808/0900766b80fe20f7-11808039.pdf?src-supplier=Rs; ComponentLink2URL: https://datasheet.ciiva.com/29183/451124-da-01-en-widerstand-0603-era-29183789.pdf?src-supplier=Conrad; ComponentLink2Description: https://datasheet.ciiva.com/29183/451124-da-01-en-widerstand-0603-era-29183789.pdf?src-supplier=Conrad; ComponentLink3URL: https://datasheet.ciiva.com/22743/485442-22743061.pdf?src-supplier=Element14; ComponentLink3Description: https://datasheet.ciiva.com/22743/485442-22743061.pdf?src-supplier=Element14; ComponentLink4URL: https://datasheet.ciiva.com/46422/485442-46422693.pdf?src-supplier=Element14; ComponentLink4Description: https://datasheet.ciiva.com/46422/485442-46422693.pdf?src-supplier=Element14; ComponentLink5URL: https://datasheet.ciiva.com/30078/54aoa0000ce26-30078815.pdf?src-supplier=Onlinecomponents.com; ComponentLink5Description: https://datasheet.ciiva.com/30078/54aoa0000ce26-30078815.pdf?src-supplier=Onlinecomponents.com; ComponentLink6URL: https://datasheet.ciiva.com/16772/70068849-16772572.pdf?src-supplier=Allied+Electronics; ComponentLink6Description: https://datasheet.ciiva.com/16772/70068849-16772572.pdf?src-supplier=Allied+Electronics; ComponentLink7URL: https://datasheet.ciiva.com/48425/era-eng-tds-48425470.pdf?src-supplier=Distrelec; ComponentLink7Description: https://datasheet.ciiva.com/48425/era-eng-tds-48425470.pdf?src-supplier=Distrelec; ComponentLink8URL: https://datasheet.ciiva.com/22781/485442-22781497.pdf?src-supplier=Farnell; ComponentLink8Description: https://datasheet.ciiva.com/22781/485442-22781497.pdf?src-supplier=Farnell; ComponentLink9URL: https://datasheet.ciiva.com/43455/485442-43455227.pdf?src-supplier=Farnell; ComponentLink9Description: https://datasheet.ciiva.com/43455/485442-43455227.pdf?src-supplier=Farnell; ComponentLink10URL: https://datasheet.ciiva.com/9117/aoa0000ce26-9117707.pdf?src-supplier=Avnet; ComponentLink10Description: https://datasheet.ciiva.com/9117/aoa0000ce26-9117707.pdf?src-supplier=Avnet; ComponentLink11URL: https://datasheet.ciiva.com/9116/aoa0000ce26-9116681.pdf?src-supplier=Avnet; ComponentLink11Description: https://datasheet.ciiva.com/9116/aoa0000ce26-9116681.pdf?src-supplier=Avnet
R90 = YC164-JR-0722RL: RES ARRAY 4 RES 22 OHM 1206; Manufacturer: Yageo; Supplier: Future Electronics; Supplier Part Number: 4472155; Manufacturer Part Number: YC164-JR-0722RL; RoHS: Yes; Category: Resistor Arrays; Stock: 225000; Pricing: 5000=0.0084, 20000=0.008, 50000=0.0078, 125000=0.0075, 200000=0.0071 (USD); ComponentLink1URL: https://datasheet.ciiva.com/8018/443424-8018007.pdf?src-supplier=Element14; ComponentLink1Description: https://datasheet.ciiva.com/8018/443424-8018007.pdf?src-supplier=Element14; ComponentLink2URL: https://datasheet.ciiva.com/8018/443424-8018008.pdf?src-supplier=Element14; ComponentLink2Description: https://datasheet.ciiva.com/8018/443424-8018008.pdf?src-supplier=Element14; ComponentLink3URL: https://datasheet.ciiva.com/2688/pyu-yc-tc164-51-rohs-l-3-2688422.pdf?src-supplier=Digi-Key; ComponentLink3Description: https://datasheet.ciiva.com/2688/pyu-yc-tc164-51-rohs-l-3-2688422.pdf?src-supplier=Digi-Key; ComponentLink4URL: https://datasheet.ciiva.com/2688/pyu-yc-tc164-51-rohs-l-3-2688421.pdf?src-supplier=Digi-Key; ComponentLink4Description: https://datasheet.ciiva.com/2688/pyu-yc-tc164-51-rohs-l-3-2688421.pdf?src-supplier=Digi-Key; ComponentLink5URL: https://datasheet.ciiva.com/8320/pyu-yc-tc164-51-rohs-l-3-8320230.pdf?src-supplier=Avnet; ComponentLink5Description: https://datasheet.ciiva.com/8320/pyu-yc-tc164-51-rohs-l-3-8320230.pdf?src-supplier=Avnet; ComponentLink6URL: https://datasheet.ciiva.com/2688/pyu-yc-tc164-51-rohs-l-3-2688423.pdf?src-supplier=Digi-Key; ComponentLink6Description: https://datasheet.ciiva.com/2688/pyu-yc-tc164-51-rohs-l-3-2688423.pdf?src-supplier=Digi-Key; ComponentLink7URL: https://datasheet.ciiva.com/17030/pyu-yc-tc164-51-rohs-l-3-17030158.pdf?src-supplier=Future+Electronics; ComponentLink7Description: https://datasheet.ciiva.com/17030/pyu-yc-tc164-51-rohs-l-3-17030158.pdf?src-supplier=Future+Electronics; ComponentLink8URL: https://datasheet.ciiva.com/28379/pyu-yc-tc164-51-rohs-l-3-28379358.pdf?; ComponentLink8Description: https://datasheet.ciiva.com/28379/pyu-yc-tc164-51-rohs-l-3-28379358.pdf?
R142 = RC1206JR-070RL: as R147 on sheet APALIS_POWER_SUPPLY; Supplier: Future Electronics; Supplier Part Number: 1070203; Manufacturer Part Number: RC1206JR-070RL; RoHS: Yes; Category: Chip SMD Resistors; Stock: 615000; Pricing: 5000=0.0047, 25000=0.0045, 100000=0.0042, 250000=0.0041, 625000=0.0038 (USD); Case/Package: 1206; Contact Plating: Tin,Matte; Case Code (Metric): 3216; Case Code (Imperial): 1206; Min Operating Temperature: -55°C; Max Operating Temperature: 155°C; Resistor Type: Thick Film,Carbon Film; Packaging: Tape and Reel; Package Quantity: 1; Number of Terminations: 2; Termination: SMD/SMT; Max Power Dissipation: 250mW; Series: RC; Resistance Tolerance: 5%; Technology: THICK FILM; Features: Moisture Resistant; Voltage Rating (AC): 200V; Length: 0.122inch; Width: 0.063inch; Height: 0.026inch; Depth: 1.6mm; Lead Free: Lead Free; RoHS Compliant: Yes; Reach SVHC Compliant: Unknown; ComponentLink1URL: https://datasheet.ciiva.com/11808/0900766b80c6630a-11808156.pdf?src-supplier=Rs; ComponentLink1Description: https://datasheet.ciiva.com/11808/0900766b80c6630a-11808156.pdf?src-supplier=Rs; ComponentLink2URL: https://datasheet.ciiva.com/29181/402222-da-01-en-smd-widerstand-0-ohm-1206-29181568.pdf?src-supplier=Conrad; ComponentLink2Description: https://datasheet.ciiva.com/29181/402222-da-01-en-smd-widerstand-0-ohm-1206-29181568.pdf?src-supplier=Conrad; ComponentLink3URL: https://datasheet.ciiva.com/7983/444357-7983807.pdf?src-supplier=Element14; ComponentLink3Description: https://datasheet.ciiva.com/7983/444357-7983807.pdf?src-supplier=Element14; ComponentLink4URL: https://datasheet.ciiva.com/22747/1692832-22747541.pdf?src-supplier=Element14; ComponentLink4Description: https://datasheet.ciiva.com/22747/1692832-22747541.pdf?src-supplier=Element14; ComponentLink5URL: https://datasheet.ciiva.com/46445/444357-46445719.pdf?src-supplier=Element14; ComponentLink5Description: https://datasheet.ciiva.com/46445/444357-46445719.pdf?src-supplier=Element14; ComponentLink6URL: https://datasheet.ciiva.com/2458/pyu-rc1206-51-rohs-l-4-2458669.pdf?src-supplier=Digi-Key; ComponentLink6Description: https://datasheet.ciiva.com/2458/pyu-rc1206-51-rohs-l-4-2458669.pdf?src-supplier=Digi-Key; ComponentLink7URL: https://datasheet.ciiva.com/2458/pyu-rc1206-51-rohs-l-4-2458670.pdf?src-supplier=Digi-Key; ComponentLink7Description: https://datasheet.ciiva.com/2458/pyu-rc1206-51-rohs-l-4-2458670.pdf?src-supplier=Digi-Key; ComponentLink8URL: https://datasheet.ciiva.com/2458/pyu-rc1206-51-rohs-l-4-2458668.pdf?src-supplier=Digi-Key; ComponentLink8Description: https://datasheet.ciiva.com/2458/pyu-rc1206-51-rohs-l-4-2458668.pdf?src-supplier=Digi-Key; ComponentLink9URL: https://datasheet.ciiva.com/7857/1692832-7857422.pdf?src-supplier=Element14; ComponentLink9Description: https://datasheet.ciiva.com/7857/1692832-7857422.pdf?src-supplier=Element14; ComponentLink10URL: https://datasheet.ciiva.com/7857/1692832-7857421.pdf?src-supplier=Element14; ComponentLink10Description: https://datasheet.ciiva.com/7857/1692832-7857421.pdf?src-supplier=Element14; ComponentLink11URL: https://datasheet.ciiva.com/17035/pyu-rc1206-51-rohs-l-4-17035512.pdf?src-supplier=Future+Electronics; ComponentLink11Description: https://datasheet.ciiva.com/17035/pyu-rc1206-51-rohs-l-4-17035512.pdf?src-supplier=Future+Electronics
TP39 TP40 = TEST POINT: Test Point ON; Item Type: TEST POINT
U1 = MM70-314B1-2-R300: as U1 on sheet APALIS_POWER_SUPPLY; Supplier: Digi-Key; Supplier Part Number: 670-MM70-314B1-2-R300CT-ND; Manufacturer Part Number: MM70-314B1-2-R300; RoHS: No; Category: Card Edge Connectors; Stock: 4979; Pricing: 1=9.21, 10=8.287, 25=7.8064, 50=7.6064, 100=7.4062 (USD)
U23 = TPD12S016PWR: IC INTERFACE SPECIALIZED 24TSSOP; Manufacturer: Texas Instruments; Supplier: Mouser; Supplier Part Number: 595-TPD12S016PWR; Manufacturer Part Number: TPD12S016PWR; RoHS: Yes; Category: Interface ICs; Stock: 8312; Pricing: 1=1.23, 10=1.11, 50=1.05, 100=0.863, 1000=0.563, 10000=0.495 (USD); ComponentLink1URL: https://datasheet.ciiva.com/1784/tpd12s016-1784288.pdf?src-supplier=Digi-Key; ComponentLink1Description: https://datasheet.ciiva.com/1784/tpd12s016-1784288.pdf?src-supplier=Digi-Key; ComponentLink2URL: https://datasheet.ciiva.com/1495/1506096-1495817.pdf?src-supplier=Element14; ComponentLink2Description: https://datasheet.ciiva.com/1495/1506096-1495817.pdf?src-supplier=Element14; ComponentLink3URL: https://datasheet.ciiva.com/26911/getdatasheetpartid-349978-26911477.pdf?src-supplier=Verical; ComponentLink3Description: https://datasheet.ciiva.com/26911/getdatasheetpartid-349978-26911477.pdf?src-supplier=Verical; ComponentLink4URL: https://datasheet.ciiva.com/41460/001188042-da-01-en-ic-hdmi-esd-pr-tpd12s016pwr-tssop-24-tid-41460279.pdf?src-supplier=Conrad; ComponentLink4Description: https://datasheet.ciiva.com/41460/001188042-da-01-en-ic-hdmi-esd-pr-tpd12s016pwr-tssop-24-tid-41460279.pdf?src-supplier=Conrad; ComponentLink5URL: https://datasheet.ciiva.com/3149/tpd12s016-3149560.pdf?src-supplier=Avnet; ComponentLink5Description: https://datasheet.ciiva.com/3149/tpd12s016-3149560.pdf?src-supplier=Avnet